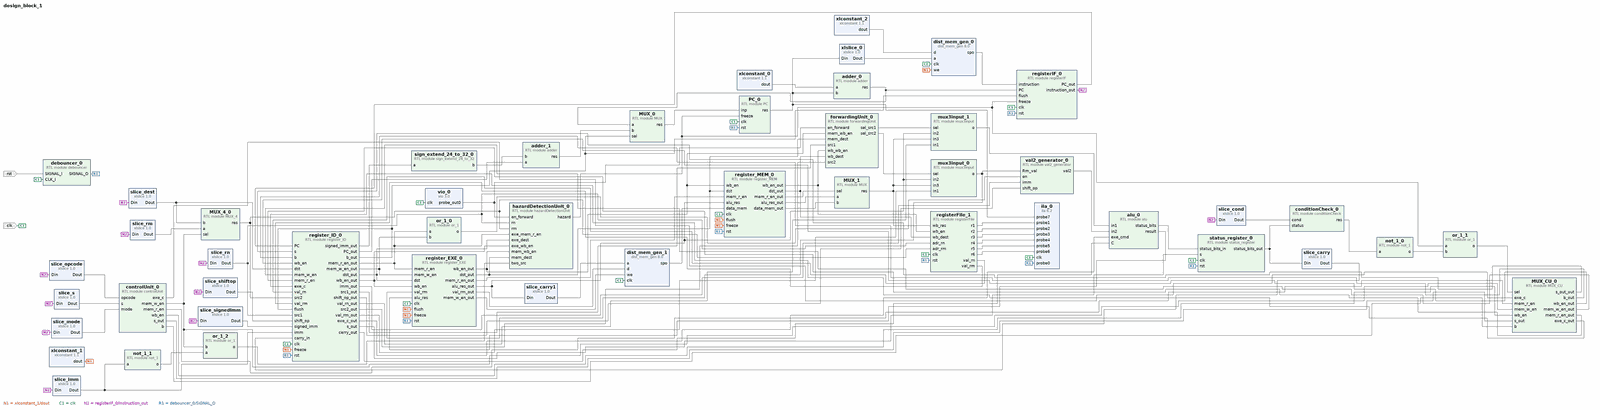
[diagram p0: block diagram of the top level, whole]
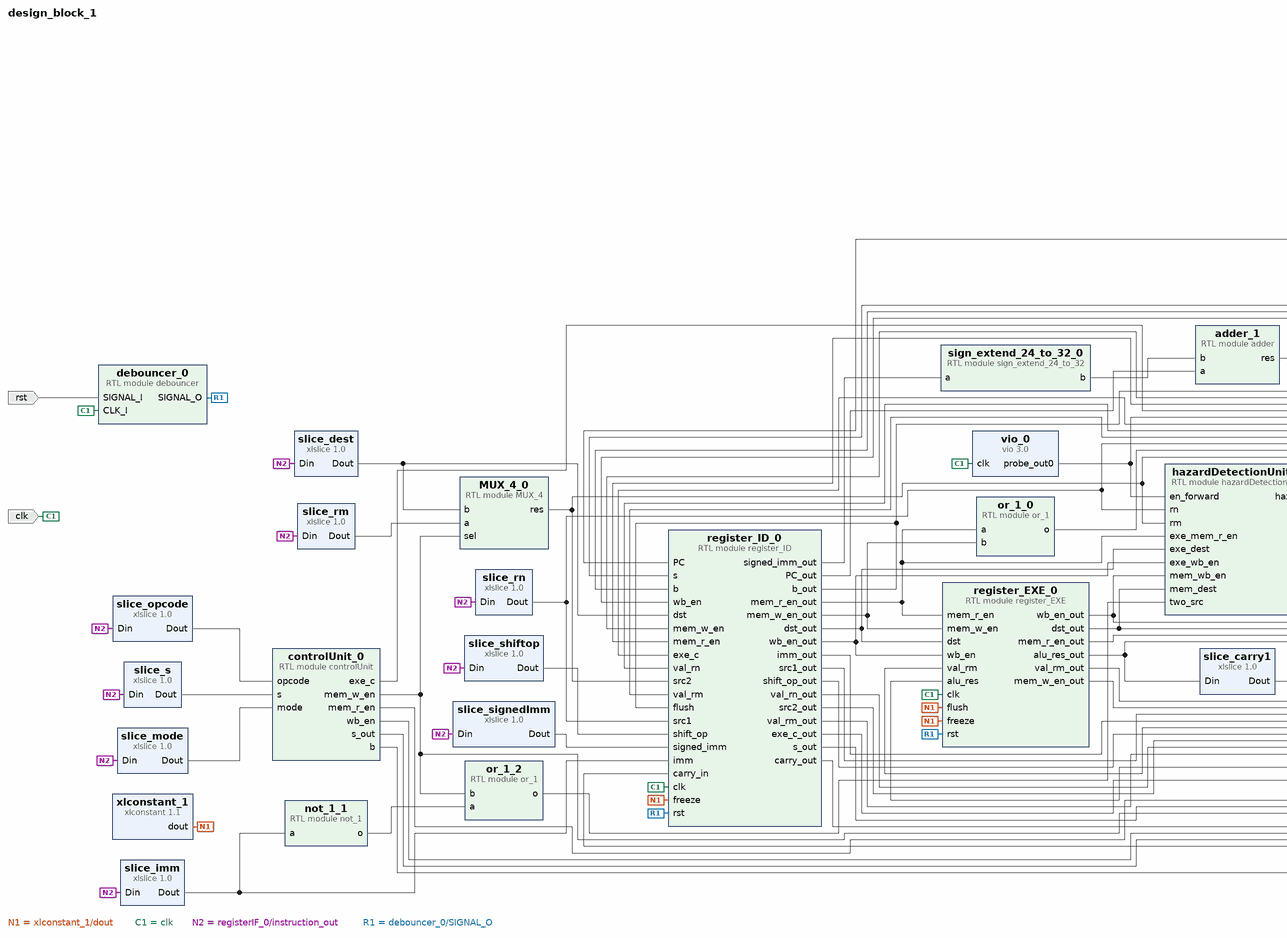
[diagram p1: block diagram of the top level, left part]
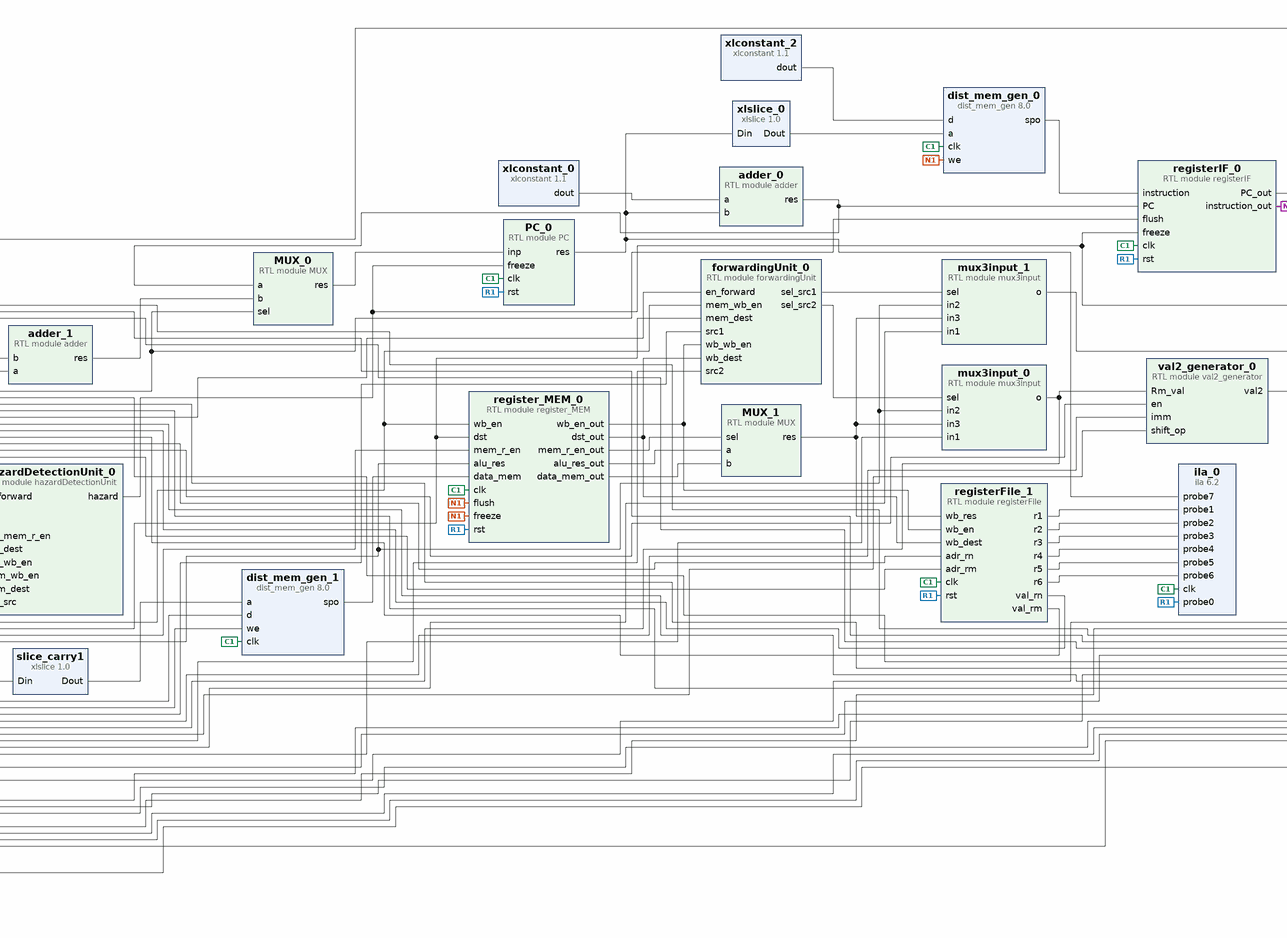
[diagram p2: block diagram of the top level, centre part]
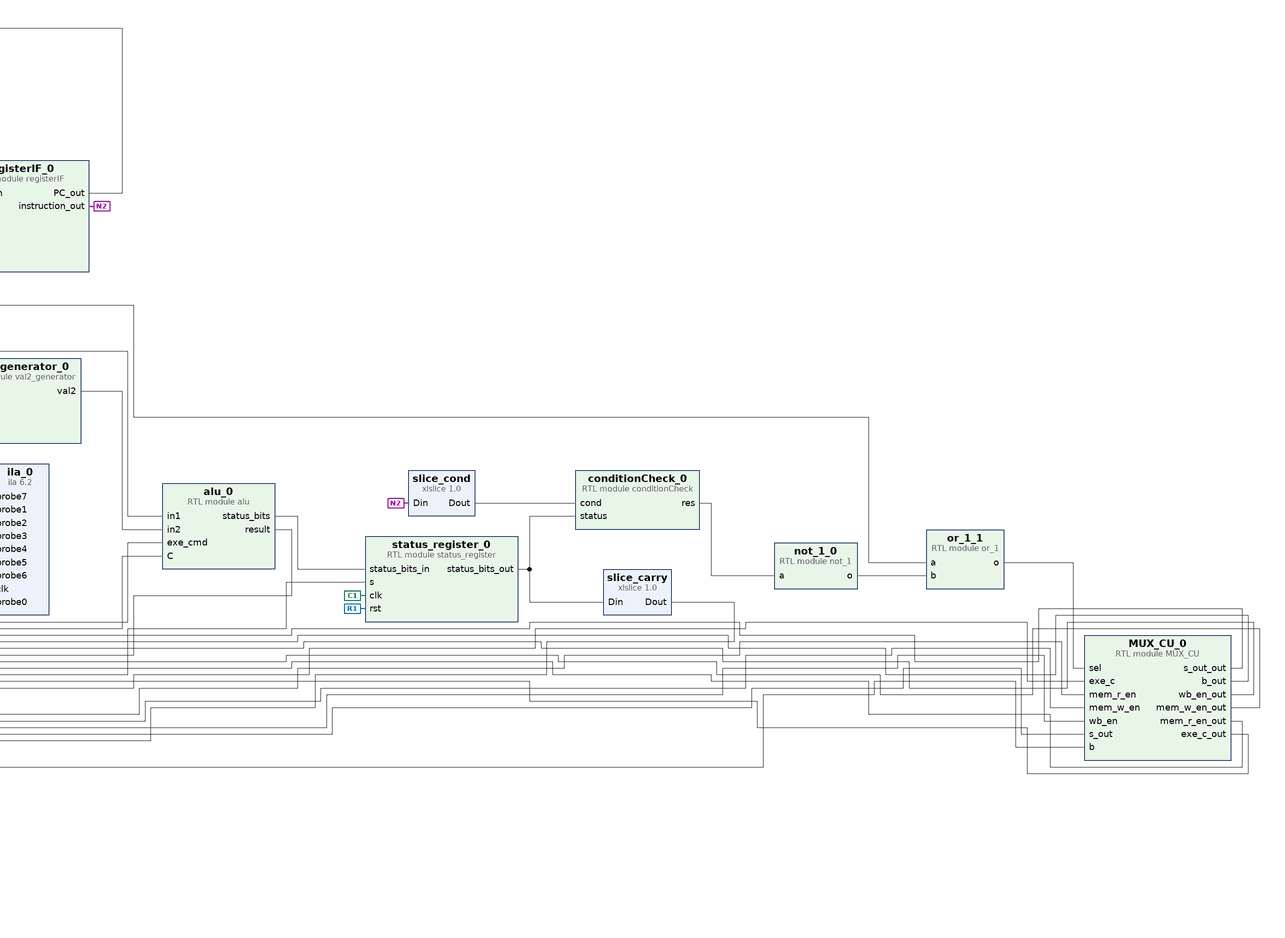
[diagram p3: block diagram of the top level, right part]
# Vivado block design design_block_1, xc7z010clg400-1, Vivado 2018.3
create_bd_design design_block_1

create_bd_port -dir I -type rst rst
create_bd_port -dir I -type clk clk
set_property -dict {CONFIG.ASSOCIATED_RESET rst} [get_bd_ports clk]

create_bd_cell -type ip -vlnv xilinx.com:ip:xlconstant:1.1 xlconstant_0
set_property -dict {CONFIG.CONST_VAL 1 CONFIG.CONST_WIDTH 32} [get_bd_cells xlconstant_0]
create_bd_cell -type ip -vlnv xilinx.com:ip:xlslice:1.0 xlslice_0
set_property -dict {CONFIG.DIN_FROM 8 CONFIG.DOUT_WIDTH 9} [get_bd_cells xlslice_0]
create_bd_cell -type ip -vlnv xilinx.com:ip:xlconstant:1.1 xlconstant_1
set_property -dict {CONFIG.CONST_VAL 0} [get_bd_cells xlconstant_1]
create_bd_cell -type module -reference MUX MUX_0
create_bd_cell -type module -reference PC PC_0
create_bd_cell -type module -reference registerIF registerIF_0
create_bd_cell -type ip -vlnv xilinx.com:ip:xlslice:1.0 slice_cond
set_property -dict {CONFIG.DIN_FROM 31 CONFIG.DIN_TO 28 CONFIG.DOUT_WIDTH 4} [get_bd_cells slice_cond]
create_bd_cell -type ip -vlnv xilinx.com:ip:xlslice:1.0 slice_s
set_property -dict {CONFIG.DIN_FROM 20 CONFIG.DIN_TO 20 CONFIG.DOUT_WIDTH 1} [get_bd_cells slice_s]
create_bd_cell -type ip -vlnv xilinx.com:ip:xlslice:1.0 slice_opcode
set_property -dict {CONFIG.DIN_FROM 24 CONFIG.DIN_TO 21 CONFIG.DOUT_WIDTH 4} [get_bd_cells slice_opcode]
create_bd_cell -type ip -vlnv xilinx.com:ip:xlslice:1.0 slice_mode
set_property -dict {CONFIG.DIN_FROM 27 CONFIG.DIN_TO 26 CONFIG.DOUT_WIDTH 2} [get_bd_cells slice_mode]
create_bd_cell -type ip -vlnv xilinx.com:ip:xlslice:1.0 slice_shiftop
set_property -dict {CONFIG.DIN_FROM 11 CONFIG.DIN_TO 0 CONFIG.DOUT_WIDTH 12} [get_bd_cells slice_shiftop]
create_bd_cell -type ip -vlnv xilinx.com:ip:xlslice:1.0 slice_dest
set_property -dict {CONFIG.DIN_FROM 15 CONFIG.DIN_TO 12 CONFIG.DOUT_WIDTH 4} [get_bd_cells slice_dest]
create_bd_cell -type ip -vlnv xilinx.com:ip:xlslice:1.0 slice_imm
set_property -dict {CONFIG.DIN_FROM 25 CONFIG.DIN_TO 25 CONFIG.DOUT_WIDTH 1} [get_bd_cells slice_imm]
create_bd_cell -type ip -vlnv xilinx.com:ip:xlslice:1.0 slice_signedImm
set_property -dict {CONFIG.DIN_FROM 23 CONFIG.DIN_TO 0 CONFIG.DOUT_WIDTH 24} [get_bd_cells slice_signedImm]
create_bd_cell -type ip -vlnv xilinx.com:ip:xlslice:1.0 slice_rn
set_property -dict {CONFIG.DIN_FROM 19 CONFIG.DIN_TO 16 CONFIG.DOUT_WIDTH 4} [get_bd_cells slice_rn]
create_bd_cell -type ip -vlnv xilinx.com:ip:xlslice:1.0 slice_rm
set_property -dict {CONFIG.DIN_FROM 3 CONFIG.DIN_TO 0 CONFIG.DOUT_WIDTH 4} [get_bd_cells slice_rm]
create_bd_cell -type module -reference adder adder_0
create_bd_cell -type module -reference or_1 or_1_0
create_bd_cell -type module -reference adder adder_1
create_bd_cell -type ip -vlnv xilinx.com:ip:xlslice:1.0 slice_carry
set_property -dict {CONFIG.DIN_FROM 1 CONFIG.DIN_TO 1 CONFIG.DIN_WIDTH 4 CONFIG.DOUT_WIDTH 1} [get_bd_cells slice_carry]
create_bd_cell -type module -reference MUX MUX_1
create_bd_cell -type ip -vlnv xilinx.com:ip:dist_mem_gen:8.0 dist_mem_gen_0
set_property -dict [list \
  CONFIG.coefficient_file c:/Users/Novin.SYS/Desktop/output.coe \
  CONFIG.data_width 32 \
  CONFIG.depth 512 \
] [get_bd_cells dist_mem_gen_0]
create_bd_cell -type ip -vlnv xilinx.com:ip:ila:6.2 ila_0
set_property -dict [list \
  CONFIG.C_ENABLE_ILA_AXI_MON false \
  CONFIG.C_MONITOR_TYPE Native \
  CONFIG.C_NUM_OF_PROBES 8 \
  CONFIG.C_PROBE0_TYPE 2 \
  CONFIG.C_PROBE1_TYPE 1 \
  CONFIG.C_PROBE1_WIDTH 32 \
  CONFIG.C_PROBE2_TYPE 1 \
  CONFIG.C_PROBE2_WIDTH 32 \
  CONFIG.C_PROBE3_TYPE 1 \
  CONFIG.C_PROBE3_WIDTH 32 \
  CONFIG.C_PROBE4_TYPE 1 \
  CONFIG.C_PROBE4_WIDTH 32 \
  CONFIG.C_PROBE5_TYPE 1 \
  CONFIG.C_PROBE5_WIDTH 32 \
  CONFIG.C_PROBE6_TYPE 1 \
  CONFIG.C_PROBE6_WIDTH 32 \
  CONFIG.C_PROBE7_TYPE 1 \
  CONFIG.C_PROBE7_WIDTH 32 \
] [get_bd_cells ila_0]
create_bd_cell -type module -reference or_1 or_1_1
create_bd_cell -type module -reference or_1 or_1_2
create_bd_cell -type ip -vlnv xilinx.com:ip:dist_mem_gen:8.0 dist_mem_gen_1
set_property -dict {CONFIG.data_width 32 CONFIG.depth 1024} [get_bd_cells dist_mem_gen_1]
create_bd_cell -type ip -vlnv xilinx.com:ip:xlslice:1.0 slice_carry1
set_property -dict {CONFIG.DIN_FROM 9 CONFIG.DIN_TO 0 CONFIG.DIN_WIDTH 32 CONFIG.DOUT_WIDTH 2} [get_bd_cells slice_carry1]
create_bd_cell -type ip -vlnv xilinx.com:ip:xlconstant:1.1 xlconstant_2
set_property -dict {CONFIG.CONST_VAL 0 CONFIG.CONST_WIDTH 32} [get_bd_cells xlconstant_2]
create_bd_cell -type module -reference alu alu_0
create_bd_cell -type module -reference register_EXE register_EXE_0
create_bd_cell -type module -reference sign_extend_24_to_32 sign_extend_24_to_32_0
create_bd_cell -type module -reference status_register status_register_0
create_bd_cell -type module -reference val2_generator val2_generator_0
create_bd_cell -type module -reference MUX_4 MUX_4_0
create_bd_cell -type module -reference MUX_CU MUX_CU_0
create_bd_cell -type module -reference conditionCheck conditionCheck_0
create_bd_cell -type module -reference controlUnit controlUnit_0
create_bd_cell -type module -reference not_1 not_1_0
create_bd_cell -type module -reference not_1 not_1_1
create_bd_cell -type module -reference registerFile registerFile_1
create_bd_cell -type module -reference register_ID register_ID_0
create_bd_cell -type module -reference forwardingUnit forwardingUnit_0
create_bd_cell -type module -reference hazardDetectionUnit hazardDetectionUnit_0
create_bd_cell -type module -reference mux3input mux3input_0
create_bd_cell -type module -reference mux3input mux3input_1
create_bd_cell -type module -reference register_MEM register_MEM_0
create_bd_cell -type module -reference debouncer debouncer_0
create_bd_cell -type ip -vlnv xilinx.com:ip:vio:3.0 vio_0
set_property -dict {CONFIG.C_NUM_PROBE_IN 0} [get_bd_cells vio_0]

# ---- connections ----

connect_bd_net -net MUX_0_out [get_bd_pins MUX_0/res] [get_bd_pins PC_0/inp]
connect_bd_net [get_bd_pins xlconstant_0/dout] [get_bd_pins adder_0/a]
connect_bd_net [get_bd_pins xlslice_0/Dout] [get_bd_pins dist_mem_gen_0/a]
connect_bd_net [get_bd_pins PC_0/res] [get_bd_pins xlslice_0/Din] [get_bd_pins adder_0/b] [get_bd_pins ila_0/probe7]
connect_bd_net [get_bd_pins xlconstant_1/dout] \
  [get_bd_pins dist_mem_gen_0/we] [get_bd_pins register_EXE_0/freeze] [get_bd_pins register_EXE_0/flush] \
  [get_bd_pins register_ID_0/freeze] [get_bd_pins register_MEM_0/freeze] [get_bd_pins register_MEM_0/flush]
connect_bd_net -net adder_0_out [get_bd_pins adder_0/res] [get_bd_pins MUX_0/a] [get_bd_pins registerIF_0/PC]
connect_bd_net -net clk_0_1 [get_bd_ports clk] \
  [get_bd_pins PC_0/clk] [get_bd_pins registerIF_0/clk] [get_bd_pins dist_mem_gen_0/clk] [get_bd_pins ila_0/clk] \
  [get_bd_pins dist_mem_gen_1/clk] [get_bd_pins register_EXE_0/clk] [get_bd_pins status_register_0/clk] \
  [get_bd_pins registerFile_1/clk] [get_bd_pins register_ID_0/clk] [get_bd_pins register_MEM_0/clk] \
  [get_bd_pins debouncer_0/CLK_I] [get_bd_pins vio_0/clk]
connect_bd_net [get_bd_pins registerIF_0/PC_out] [get_bd_pins register_ID_0/PC]
connect_bd_net [get_bd_pins registerIF_0/instruction_out] \
  [get_bd_pins slice_cond/Din] [get_bd_pins slice_s/Din] [get_bd_pins slice_opcode/Din] [get_bd_pins slice_mode/Din] \
  [get_bd_pins slice_shiftop/Din] [get_bd_pins slice_dest/Din] [get_bd_pins slice_imm/Din] [get_bd_pins slice_signedImm/Din] \
  [get_bd_pins slice_rn/Din] [get_bd_pins slice_rm/Din]
connect_bd_net -net xlslice_1_Dout [get_bd_pins slice_cond/Dout] [get_bd_pins conditionCheck_0/cond]
connect_bd_net [get_bd_pins conditionCheck_0/res] [get_bd_pins not_1_0/a]
connect_bd_net [get_bd_pins MUX_CU_0/s_out_out] [get_bd_pins register_ID_0/s]
connect_bd_net [get_bd_pins MUX_CU_0/b_out] [get_bd_pins register_ID_0/b]
connect_bd_net [get_bd_pins MUX_CU_0/wb_en_out] [get_bd_pins register_ID_0/wb_en]
connect_bd_net [get_bd_pins MUX_CU_0/mem_w_en_out] [get_bd_pins register_ID_0/mem_w_en]
connect_bd_net [get_bd_pins MUX_CU_0/mem_r_en_out] [get_bd_pins register_ID_0/mem_r_en]
connect_bd_net [get_bd_pins MUX_CU_0/exe_c_out] [get_bd_pins register_ID_0/exe_c]
connect_bd_net [get_bd_pins slice_opcode/Dout] [get_bd_pins controlUnit_0/opcode]
connect_bd_net [get_bd_pins controlUnit_0/exe_c] [get_bd_pins MUX_CU_0/exe_c]
connect_bd_net [get_bd_pins controlUnit_0/mem_r_en] [get_bd_pins MUX_CU_0/mem_r_en]
connect_bd_net [get_bd_pins controlUnit_0/mem_w_en] [get_bd_pins or_1_2/b] [get_bd_pins MUX_4_0/sel] [get_bd_pins MUX_CU_0/mem_w_en]
connect_bd_net [get_bd_pins controlUnit_0/wb_en] [get_bd_pins MUX_CU_0/wb_en]
connect_bd_net [get_bd_pins controlUnit_0/s_out] [get_bd_pins MUX_CU_0/s_out]
connect_bd_net [get_bd_pins controlUnit_0/b] [get_bd_pins MUX_CU_0/b]
connect_bd_net [get_bd_pins slice_dest/Dout] [get_bd_pins MUX_4_0/b] [get_bd_pins register_ID_0/dst]
connect_bd_net [get_bd_pins registerFile_1/val_rn] [get_bd_pins register_ID_0/val_rn]
connect_bd_net [get_bd_pins registerFile_1/val_rm] [get_bd_pins register_ID_0/val_rm]
connect_bd_net [get_bd_pins slice_rn/Dout] [get_bd_pins registerFile_1/adr_rn] [get_bd_pins register_ID_0/src1] [get_bd_pins hazardDetectionUnit_0/rn]
connect_bd_net [get_bd_pins MUX_4_0/res] [get_bd_pins registerFile_1/adr_rm] [get_bd_pins register_ID_0/src2] [get_bd_pins hazardDetectionUnit_0/rm]
connect_bd_net [get_bd_pins slice_rm/Dout] [get_bd_pins MUX_4_0/a]
connect_bd_net [get_bd_pins slice_imm/Dout] [get_bd_pins not_1_1/a] [get_bd_pins register_ID_0/imm]
connect_bd_net [get_bd_pins slice_shiftop/Dout] [get_bd_pins register_ID_0/shift_op]
connect_bd_net [get_bd_pins slice_signedImm/Dout] [get_bd_pins register_ID_0/signed_imm]
connect_bd_net [get_bd_pins slice_s/Dout] [get_bd_pins controlUnit_0/s]
connect_bd_net [get_bd_pins slice_mode/Dout] [get_bd_pins controlUnit_0/mode]
connect_bd_net [get_bd_pins register_ID_0/mem_r_en_out] \
  [get_bd_pins or_1_0/a] [get_bd_pins register_EXE_0/mem_r_en] [get_bd_pins hazardDetectionUnit_0/exe_mem_r_en]
connect_bd_net [get_bd_pins register_ID_0/mem_w_en_out] [get_bd_pins or_1_0/b] [get_bd_pins register_EXE_0/mem_w_en]
connect_bd_net [get_bd_pins or_1_0/o] [get_bd_pins val2_generator_0/en]
connect_bd_net [get_bd_pins register_ID_0/imm_out] [get_bd_pins val2_generator_0/imm]
connect_bd_net -net register_ID_0_val_rm_out [get_bd_pins mux3input_0/o] [get_bd_pins register_EXE_0/val_rm] [get_bd_pins val2_generator_0/Rm_val]
connect_bd_net [get_bd_pins register_ID_0/shift_op_out] [get_bd_pins val2_generator_0/shift_op]
connect_bd_net [get_bd_pins register_ID_0/signed_imm_out] [get_bd_pins sign_extend_24_to_32_0/a]
connect_bd_net -net sign_extend_24_to_32_0_out [get_bd_pins sign_extend_24_to_32_0/b] [get_bd_pins adder_1/b]
connect_bd_net [get_bd_pins register_ID_0/PC_out] [get_bd_pins adder_1/a]
connect_bd_net [get_bd_pins register_ID_0/exe_c_out] [get_bd_pins alu_0/exe_cmd]
connect_bd_net [get_bd_pins val2_generator_0/val2] [get_bd_pins alu_0/in2]
connect_bd_net [get_bd_pins register_ID_0/val_rn_out] [get_bd_pins mux3input_1/in1]
connect_bd_net [get_bd_pins alu_0/result] [get_bd_pins register_EXE_0/alu_res]
connect_bd_net [get_bd_pins register_ID_0/dst_out] [get_bd_pins register_EXE_0/dst] [get_bd_pins hazardDetectionUnit_0/exe_dest]
connect_bd_net [get_bd_pins register_ID_0/wb_en_out] [get_bd_pins register_EXE_0/wb_en] [get_bd_pins hazardDetectionUnit_0/exe_wb_en]
connect_bd_net [get_bd_pins adder_1/res] [get_bd_pins MUX_0/b]
connect_bd_net [get_bd_pins register_ID_0/b_out] [get_bd_pins registerIF_0/flush] [get_bd_pins MUX_0/sel] [get_bd_pins register_ID_0/flush]
connect_bd_net [get_bd_pins register_ID_0/s_out] [get_bd_pins status_register_0/s]
connect_bd_net [get_bd_pins alu_0/status_bits] [get_bd_pins status_register_0/status_bits_in]
connect_bd_net [get_bd_pins status_register_0/status_bits_out] [get_bd_pins slice_carry/Din] [get_bd_pins conditionCheck_0/status]
connect_bd_net [get_bd_pins slice_carry/Dout] [get_bd_pins register_ID_0/carry_in]
connect_bd_net [get_bd_pins register_ID_0/carry_out] [get_bd_pins alu_0/C]
connect_bd_net [get_bd_pins register_EXE_0/wb_en_out] \
  [get_bd_pins forwardingUnit_0/mem_wb_en] [get_bd_pins hazardDetectionUnit_0/mem_wb_en] [get_bd_pins register_MEM_0/wb_en]
connect_bd_net [get_bd_pins register_EXE_0/mem_r_en_out] [get_bd_pins register_MEM_0/mem_r_en]
connect_bd_net [get_bd_pins register_EXE_0/dst_out] \
  [get_bd_pins forwardingUnit_0/mem_dest] [get_bd_pins hazardDetectionUnit_0/mem_dest] [get_bd_pins register_MEM_0/dst]
connect_bd_net [get_bd_pins register_EXE_0/alu_res_out] \
  [get_bd_pins slice_carry1/Din] [get_bd_pins mux3input_0/in2] [get_bd_pins mux3input_1/in2] \
  [get_bd_pins register_MEM_0/alu_res]
connect_bd_net [get_bd_pins register_MEM_0/mem_r_en_out] [get_bd_pins MUX_1/sel]
connect_bd_net [get_bd_pins register_MEM_0/alu_res_out] [get_bd_pins MUX_1/a]
connect_bd_net [get_bd_pins register_MEM_0/data_mem_out] [get_bd_pins MUX_1/b]
connect_bd_net [get_bd_pins register_MEM_0/wb_en_out] [get_bd_pins registerFile_1/wb_en] [get_bd_pins forwardingUnit_0/wb_wb_en]
connect_bd_net [get_bd_pins MUX_1/res] [get_bd_pins registerFile_1/wb_res] [get_bd_pins mux3input_0/in3] [get_bd_pins mux3input_1/in3]
connect_bd_net [get_bd_pins register_MEM_0/dst_out] [get_bd_pins registerFile_1/wb_dest] [get_bd_pins forwardingUnit_0/wb_dest]
connect_bd_net [get_bd_pins xlconstant_2/dout] [get_bd_pins dist_mem_gen_0/d]
connect_bd_net [get_bd_pins dist_mem_gen_0/spo] [get_bd_pins registerIF_0/instruction]
connect_bd_net -net rst_1 [get_bd_pins debouncer_0/SIGNAL_O] \
  [get_bd_pins PC_0/rst] [get_bd_pins registerIF_0/rst] [get_bd_pins ila_0/probe0] [get_bd_pins register_EXE_0/rst] \
  [get_bd_pins status_register_0/rst] [get_bd_pins registerFile_1/rst] [get_bd_pins register_ID_0/rst] \
  [get_bd_pins register_MEM_0/rst]
connect_bd_net [get_bd_pins or_1_1/o] [get_bd_pins MUX_CU_0/sel]
connect_bd_net [get_bd_pins not_1_0/o] [get_bd_pins or_1_1/b]
connect_bd_net [get_bd_pins hazardDetectionUnit_0/hazard] [get_bd_pins or_1_1/a] [get_bd_pins registerIF_0/freeze] [get_bd_pins PC_0/freeze]
connect_bd_net [get_bd_pins or_1_2/o] [get_bd_pins hazardDetectionUnit_0/two_src]
connect_bd_net [get_bd_pins not_1_1/o] [get_bd_pins or_1_2/a]
connect_bd_net [get_bd_pins slice_carry1/Dout] [get_bd_pins dist_mem_gen_1/a]
connect_bd_net [get_bd_pins register_EXE_0/val_rm_out] [get_bd_pins dist_mem_gen_1/d]
connect_bd_net [get_bd_pins register_EXE_0/mem_w_en_out] [get_bd_pins dist_mem_gen_1/we]
connect_bd_net [get_bd_pins dist_mem_gen_1/spo] [get_bd_pins register_MEM_0/data_mem]
connect_bd_net [get_bd_pins registerFile_1/r1] [get_bd_pins ila_0/probe1]
connect_bd_net [get_bd_pins registerFile_1/r2] [get_bd_pins ila_0/probe2]
connect_bd_net [get_bd_pins registerFile_1/r3] [get_bd_pins ila_0/probe3]
connect_bd_net [get_bd_pins registerFile_1/r4] [get_bd_pins ila_0/probe4]
connect_bd_net [get_bd_pins registerFile_1/r5] [get_bd_pins ila_0/probe5]
connect_bd_net [get_bd_pins registerFile_1/r6] [get_bd_pins ila_0/probe6]
connect_bd_net [get_bd_pins mux3input_1/o] [get_bd_pins alu_0/in1]
connect_bd_net [get_bd_pins forwardingUnit_0/sel_src1] [get_bd_pins mux3input_1/sel]
connect_bd_net [get_bd_pins forwardingUnit_0/sel_src2] [get_bd_pins mux3input_0/sel]
connect_bd_net [get_bd_pins register_ID_0/val_rm_out] [get_bd_pins mux3input_0/in1]
connect_bd_net -net xlconstant_3_dout [get_bd_pins vio_0/probe_out0] \
  [get_bd_pins forwardingUnit_0/en_forward] [get_bd_pins hazardDetectionUnit_0/en_forward]
connect_bd_net [get_bd_pins register_ID_0/src1_out] [get_bd_pins forwardingUnit_0/src1]
connect_bd_net [get_bd_pins register_ID_0/src2_out] [get_bd_pins forwardingUnit_0/src2]
connect_bd_net [get_bd_ports rst] [get_bd_pins debouncer_0/SIGNAL_I]

validate_bd_design
save_bd_design
